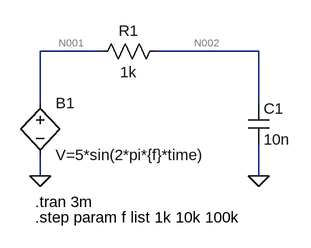
[diagram p0: schematic Behavioral.asc]
Behavioral.asc, the LTspice schematic file:
Version 4.1
SHEET 1 880 680
WIRE 80 16 -16 16
WIRE 320 16 160 16
WIRE -16 96 -16 16
WIRE 320 96 320 16
WIRE -16 208 -16 176
WIRE 320 208 320 160
FLAG -16 208 0
FLAG 320 208 0
SYMBOL res 176 0 R90
WINDOW 0 0 56 VBottom 2
WINDOW 3 32 56 VTop 2
SYMATTR InstName R1
SYMATTR Value 1k
SYMBOL cap 304 96 R0
SYMATTR InstName C1
SYMATTR Value 10n
SYMBOL bv -16 80 R0
SYMATTR InstName B1
SYMATTR Value V=5*sin(2*pi*{f}*time)
TEXT -24 248 Left 2 !.tran 3m
TEXT -24 272 Left 2 !.step param f list 1k 10k 100k

The netlist it stands for:
* Behavioral.asc
R1 N002 N001 1k
C1 N002 0 10n
B1 N001 0 V=5*sin(2*pi*{f}*time)
.tran 3m
.step param f list 1k 10k 100k
.backanno
.end

* Results of the author's LTspice run, read from the files saved beside the schematic
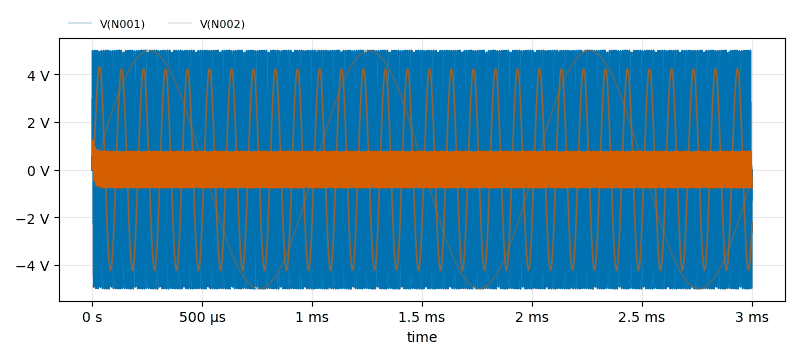
[diagram p1: Transient Analysis of Behavioral.asc, plotted from the saved traces]
* Transient Analysis, 3 runs:
*   V(N001) [f=1000]: min -5 V, max 5 V, average 0 V, rms 3.536 V, last 0 V
*   V(N001) [f=10000]: min -5 V, max 5 V, average 48.21 µV, rms 3.533 V, last 0 V
*   V(N001) [f=100000]: min -5 V, max 5 V, average -4.776 µV, rms 3.564 V, last 0 V
*   V(N002) [f=1000]: min -4.99 V, max 4.99 V, average 1.043 mV, rms 3.529 V, last -312.9 mV
*   V(N002) [f=10000]: min -4.231 V, max 4.3 V, average 7.556 mV, rms 2.994 V, last -2.252 V
*   V(N002) [f=100000]: min -768.7 mV, max 1.227 V, average 2.532 mV, rms 542.1 mV, last -761.1 mV